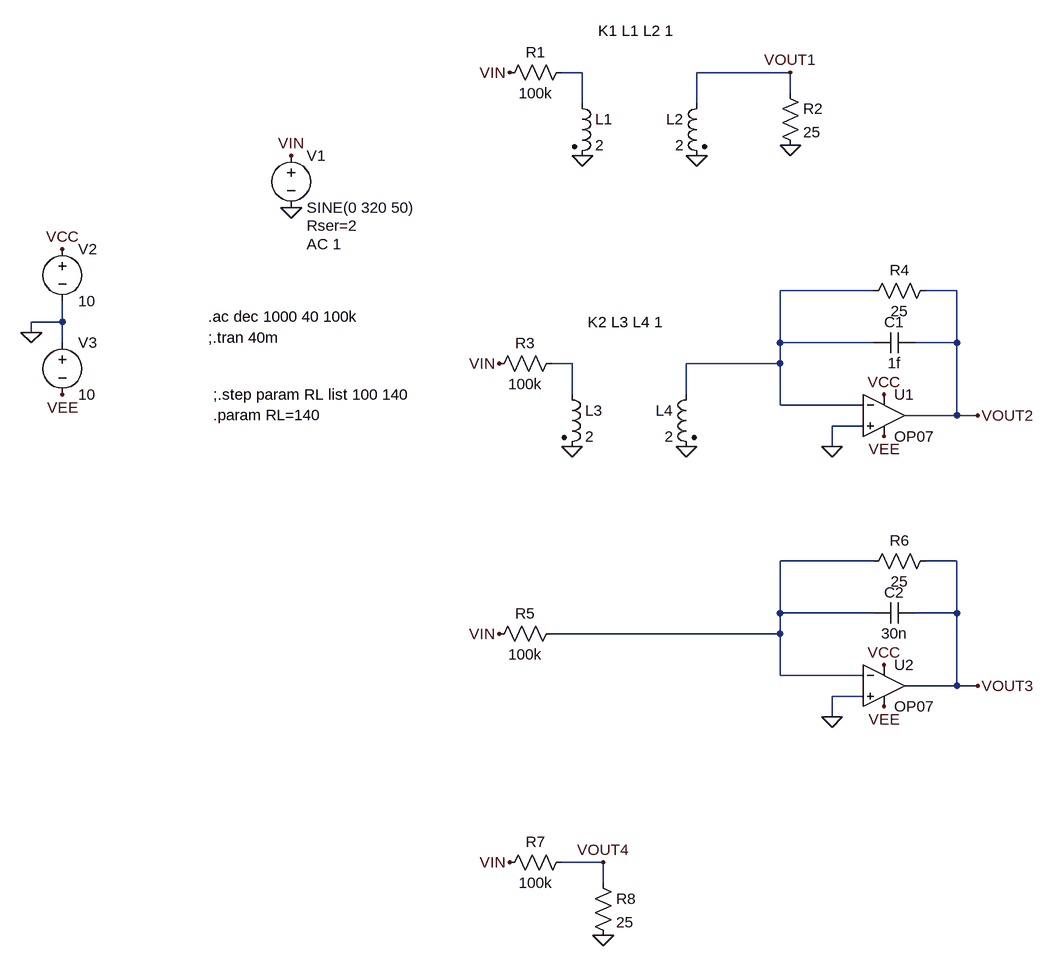
[diagram p0: schematic current_mode_voltage_transformer.asc]
current_mode_voltage_transformer.asc, the LTspice schematic file:
Version 4
SHEET 1 880 1252
WIRE 80 -96 48 -96
WIRE 400 -96 256 -96
WIRE 400 -64 400 -96
WIRE 80 -48 80 -96
WIRE 256 -48 256 -96
WIRE 528 240 384 240
WIRE 656 240 608 240
WIRE -720 288 -720 256
WIRE -720 288 -768 288
WIRE -768 304 -768 288
WIRE -720 320 -720 288
WIRE 384 320 384 240
WIRE 528 320 384 320
WIRE 656 320 656 240
WIRE 656 320 592 320
WIRE 64 352 32 352
WIRE 384 352 384 320
WIRE 384 352 240 352
WIRE 64 400 64 352
WIRE 240 400 240 352
WIRE 384 416 384 352
WIRE 512 416 384 416
WIRE 656 432 656 320
WIRE 656 432 576 432
WIRE 688 432 656 432
WIRE 512 448 464 448
WIRE 464 480 464 448
WIRE 528 656 384 656
WIRE 656 656 608 656
WIRE 384 736 384 656
WIRE 528 736 384 736
WIRE 656 736 656 656
WIRE 656 736 592 736
WIRE 384 768 384 736
WIRE 384 768 32 768
WIRE 384 832 384 768
WIRE 512 832 384 832
WIRE 656 848 656 736
WIRE 656 848 576 848
WIRE 688 848 656 848
WIRE 512 864 464 864
WIRE 464 896 464 864
WIRE 112 1120 48 1120
WIRE 112 1152 112 1120
FLAG -368 112 0
FLAG -368 32 VIN
FLAG -32 -96 VIN
FLAG 80 32 0
FLAG 256 32 0
FLAG 400 16 0
FLAG 400 -96 VOUT1
FLAG -48 352 VIN
FLAG 64 480 0
FLAG 240 480 0
FLAG 688 432 VOUT2
FLAG -768 304 0
FLAG -720 176 VCC
FLAG 544 400 VCC
FLAG -720 400 VEE
FLAG 544 464 VEE
FLAG 464 480 0
FLAG -48 768 VIN
FLAG 688 848 VOUT3
FLAG 544 816 VCC
FLAG 544 880 VEE
FLAG 464 896 0
FLAG -32 1120 VIN
FLAG 112 1232 0
FLAG 112 1120 VOUT4
SYMBOL ind2 64 -64 R0
SYMATTR InstName L1
SYMATTR Value 2
SYMATTR Type ind
SYMATTR SpiceLine Rser={RL}
SYMBOL ind2 272 -64 M0
SYMATTR InstName L2
SYMATTR Value 2
SYMATTR Type ind
SYMATTR SpiceLine Rser={RL}
SYMBOL res -48 -80 R270
WINDOW 0 32 56 VTop 2
WINDOW 3 0 56 VBottom 2
SYMATTR InstName R1
SYMATTR Value 100k
SYMBOL voltage -368 16 R0
WINDOW 123 24 152 Left 2
WINDOW 39 24 124 Left 2
SYMATTR Value2 AC 1
SYMATTR SpiceLine Rser=2
SYMATTR InstName V1
SYMATTR Value SINE(0 320 50)
SYMBOL res 384 -80 R0
SYMATTR InstName R2
SYMATTR Value 25
SYMBOL ind2 48 384 R0
SYMATTR InstName L3
SYMATTR Value 2
SYMATTR Type ind
SYMATTR SpiceLine Rser={RL}
SYMBOL ind2 256 384 M0
SYMATTR InstName L4
SYMATTR Value 2
SYMATTR Type ind
SYMATTR SpiceLine Rser={RL}
SYMBOL res 48 336 R90
WINDOW 0 0 56 VBottom 2
WINDOW 3 32 56 VTop 2
SYMATTR InstName R3
SYMATTR Value 100k
SYMBOL OpAmps\\OP07 544 368 R0
SYMATTR InstName U1
SYMBOL res 512 256 R270
WINDOW 0 32 56 VTop 2
WINDOW 3 0 56 VBottom 2
SYMATTR InstName R4
SYMATTR Value 25
SYMBOL voltage -720 160 R0
WINDOW 123 0 0 Left 0
WINDOW 39 0 0 Left 0
SYMATTR InstName V2
SYMATTR Value 10
SYMBOL voltage -720 304 R0
WINDOW 123 0 0 Left 0
WINDOW 39 0 0 Left 0
SYMATTR InstName V3
SYMATTR Value 10
SYMBOL cap 592 304 R90
WINDOW 0 0 32 VBottom 2
WINDOW 3 32 32 VTop 2
SYMATTR InstName C1
SYMATTR Value 1f
SYMBOL res 48 752 R90
WINDOW 0 0 56 VBottom 2
WINDOW 3 32 56 VTop 2
SYMATTR InstName R5
SYMATTR Value 100k
SYMBOL OpAmps\\OP07 544 784 R0
SYMATTR InstName U2
SYMBOL res 512 672 R270
WINDOW 0 32 56 VTop 2
WINDOW 3 0 56 VBottom 2
SYMATTR InstName R6
SYMATTR Value 25
SYMBOL cap 592 720 R90
WINDOW 0 0 32 VBottom 2
WINDOW 3 32 32 VTop 2
SYMATTR InstName C2
SYMATTR Value 30n
SYMBOL res 64 1104 R90
WINDOW 0 0 56 VBottom 2
WINDOW 3 32 56 VTop 2
SYMATTR InstName R7
SYMATTR Value 100k
SYMBOL res 96 1136 R0
SYMATTR InstName R8
SYMATTR Value 25
TEXT 104 -160 Left 2 !K1 L1 L2 1
TEXT 88 288 Left 2 !K2 L3 L4 1
TEXT -496 312 Left 2 !;.tran 40m
TEXT -496 280 Left 2 !.ac dec 1000 40 100k
TEXT -488 400 Left 2 !;.step param RL list 100 140\n.param RL=140

The netlist it stands for:
* current_mode_voltage_transformer.asc
L1 N001 0 2 Rser={RL}
L2 VOUT1 0 2 Rser={RL}
R1 VIN N001 100k
V1 VIN 0 SINE(0 320 50) AC 1 Rser=2
R2 VOUT1 0 25
L3 N003 0 2 Rser={RL}
L4 N002 0 2 Rser={RL}
R3 N003 VIN 100k
XU1 0 N002 VCC VEE VOUT2 LT1001  ; OP07, pins In+ In- V+ V- OUT
R4 N002 VOUT2 25
V2 VCC 0 10
V3 0 VEE 10
C1 VOUT2 N002 1f
R5 N004 VIN 100k
XU2 0 N004 VCC VEE VOUT3 LT1001  ; OP07, pins In+ In- V+ V- OUT
R6 N004 VOUT3 25
C2 VOUT3 N004 30n
R7 VOUT4 VIN 100k
R8 VOUT4 0 25
K1 L1 L2 1
K2 L3 L4 1
;.tran 40m
.ac dec 1000 40 100k
;.step param RL list 100 140
.param RL=140
.lib LTC.lib
.backanno
.end